# Altium schematic sheet Top_Sheet.SchDoc
size A4; DocumentNumber: 1; SheetNumber: 1; SheetTotal: 9
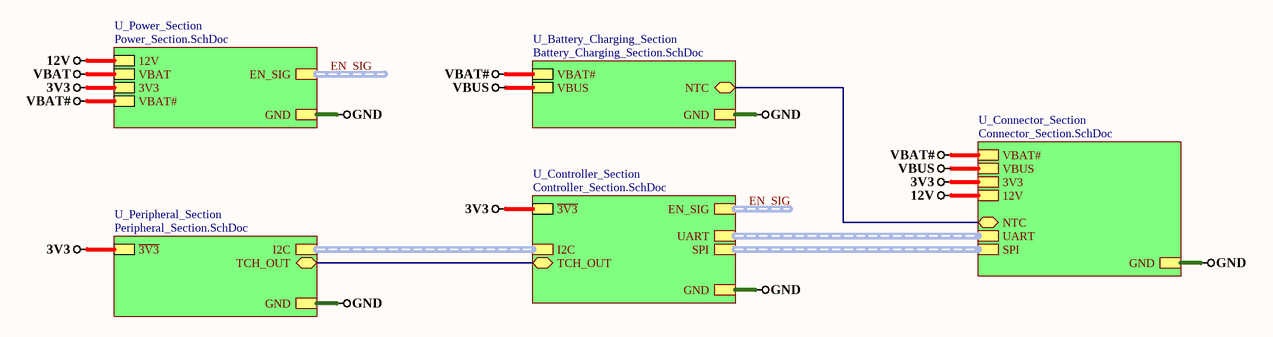
[diagram p0: Top_Sheet.SchDoc]

## Sub-sheets
U_Battery_Charging_Section = Battery_Charging_Section.SchDoc: GND, VBAT#, VBUS, NTC (bidir)
U_Connector_Section = Connector_Section.SchDoc: UART (harness UART), SPI (harness SPI), NTC (bidir), 3V3, 12V, GND, VBUS, VBAT#
U_Controller_Section = Controller_Section.SchDoc: UART (harness UART), I2C (harness I2C), TCH_OUT (bidir), ~{3V3}, GND, SPI (harness SPI), EN_SIG (harness EN_SIG)
U_Peripheral_Section = Peripheral_Section.SchDoc: ~{3V3}, GND, I2C (harness I2C), TCH_OUT (bidir)
U_Power_Section = Power_Section.SchDoc: 12V, GND, VBAT, 3V3, VBAT#, EN_SIG (harness EN_SIG)

## Nets
3V3: sheet U_Connector_Section/3V3, sheet U_Power_Section/3V3, sheet U_Peripheral_Section/~{3V3}, sheet U_Controller_Section/~{3V3}
12V: sheet U_Connector_Section/12V, sheet U_Power_Section/12V
GND: sheet U_Connector_Section/GND, sheet U_Power_Section/GND, sheet U_Peripheral_Section/GND, sheet U_Controller_Section/GND, sheet U_Battery_Charging_Section/GND
VBAT: sheet U_Power_Section/VBAT
VBAT#: sheet U_Connector_Section/VBAT#, sheet U_Power_Section/VBAT#, sheet U_Battery_Charging_Section/VBAT#
VBUS: sheet U_Connector_Section/VBUS, sheet U_Battery_Charging_Section/VBUS
(unnamed): sheet U_Connector_Section/NTC, sheet U_Battery_Charging_Section/NTC
(unnamed): sheet U_Peripheral_Section/TCH_OUT, sheet U_Controller_Section/TCH_OUT

## Buses and harness runs
harness EN_SIG = sheet U_Controller_Section/EN_SIG
harness EN_SIG = sheet U_Power_Section/EN_SIG
harness sheet U_Connector_Section/SPI = sheet U_Controller_Section/SPI
harness sheet U_Connector_Section/UART = sheet U_Controller_Section/UART
harness sheet U_Controller_Section/I2C = sheet U_Peripheral_Section/I2C